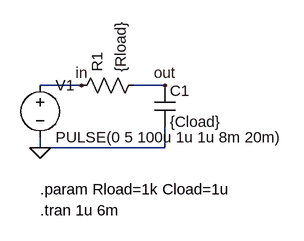
[diagram p0: schematic rc.asc]
rc.asc, the LTspice schematic file:
Version 4
SHEET 1 320 240
WIRE 64 0 0 0
WIRE 192 0 144 0
WIRE 0 96 0 80
WIRE 192 96 0 96
WIRE 192 96 192 64
FLAG 0 96 0
FLAG 64 0 in
FLAG 192 0 out
SYMBOL voltage 0 -16 R0
SYMATTR InstName V1
SYMATTR Value PULSE(0 5 100u 1u 1u 8m 20m)
SYMBOL res 48 16 R270
SYMATTR InstName R1
SYMATTR Value {Rload}
SYMBOL cap 176 0 R0
SYMATTR InstName C1
SYMATTR Value {Cload}
TEXT 0 160 Left 2 !.param Rload=1k Cload=1u
TEXT 0 192 Left 2 !.tran 1u 6m

The netlist it stands for:
* rc.asc
V1 in 0 PULSE(0 5 100u 1u 1u 8m 20m)
R1 in out {Rload}
C1 out 0 {Cload}
.param Rload=1k Cload=1u
.tran 1u 6m
.backanno
.end